# Altium schematic sheet MCU.SchDoc
size A4; SheetNumber: 2; SheetTotal: 5; ENG_APP_DATE: --/--/--; DSN_APP_DATE: --/--/--; CHK_APP_DATE: --/--/--
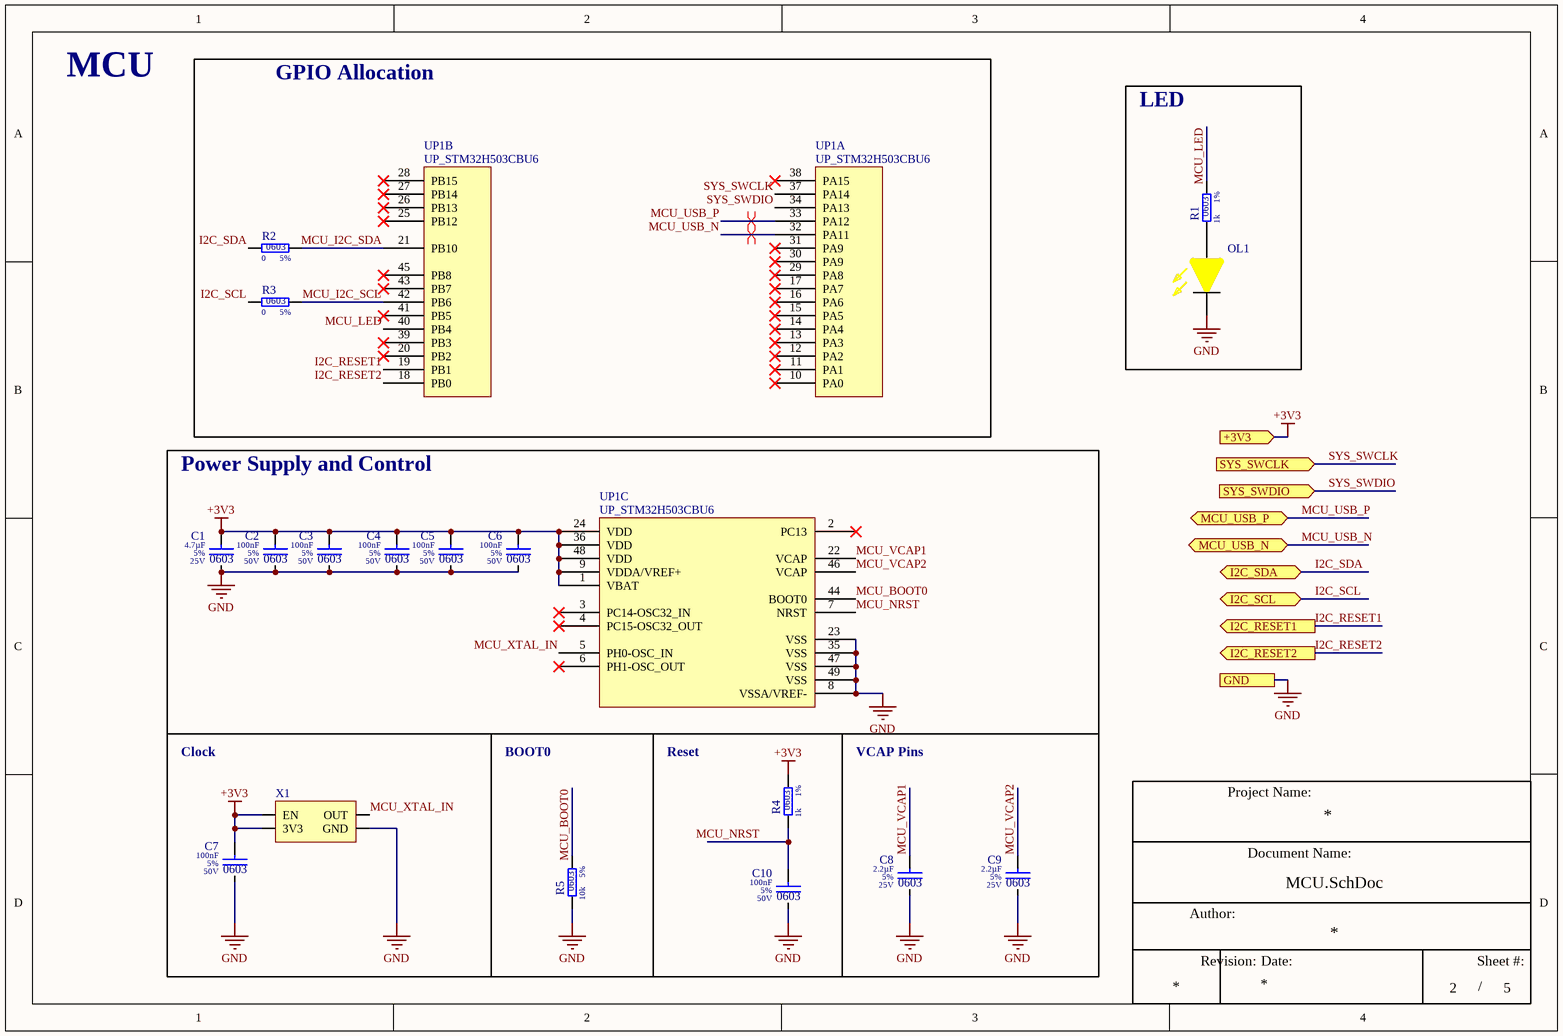
[diagram p0: MCU.SchDoc]

## Parts
C1  value 4.7µF  Tolerance: 5%  Voltage Rating: 25V  Case/Package: 0603  [0603_Capacitor]  (hidden comment: C_4.7u_25V_0603_5)
C2  value 100nF  Tolerance: 5%  Voltage Rating: 50V  Case/Package: 0603  [0603_Capacitor]  (hidden comment: C_100n_50V_0603_5)
C3  value 100nF  Tolerance: 5%  Voltage Rating: 50V  Case/Package: 0603  [0603_Capacitor]  (hidden comment: C_100n_50V_0603_5)
C4  value 100nF  Tolerance: 5%  Voltage Rating: 50V  Case/Package: 0603  [0603_Capacitor]  (hidden comment: C_100n_50V_0603_5)
C5  value 100nF  Tolerance: 5%  Voltage Rating: 50V  Case/Package: 0603  [0603_Capacitor]  (hidden comment: C_100n_50V_0603_5)
C6  value 100nF  Tolerance: 5%  Voltage Rating: 50V  Case/Package: 0603  [0603_Capacitor]  (hidden comment: C_100n_50V_0603_5)
C7  value 100nF  Tolerance: 5%  Voltage Rating: 50V  Case/Package: 0603  [0603_Capacitor]  (hidden comment: C_100n_50V_0603_5)
C8  value 2.2µF  Tolerance: 5%  Voltage Rating: 25V  Case/Package: 0603  [0603_Capacitor]  (hidden comment: C_2.2u_25V_0603_5)
C9  value 2.2µF  Tolerance: 5%  Voltage Rating: 25V  Case/Package: 0603  [0603_Capacitor]  (hidden comment: C_2.2u_25V_0603_5)
C10  value 100nF  Tolerance: 5%  Voltage Rating: 50V  Case/Package: 0603  [0603_Capacitor]  (hidden comment: C_100n_50V_0603_5)
OL1  SML-LX0603SYW-TR  [LEDC1608X60N]  (value not drawn)
R1  Tolerance: 1%  Resistance: 1k  Case/Package: 0603  [0603_Resistor]  (hidden comment: R_1k_0603_1)
R2  Tolerance: 5%  Resistance: 0  Case/Package: 0603  [0603_Resistor]  (hidden comment: R_0_0603_5)
R3  Tolerance: 5%  Resistance: 0  Case/Package: 0603  [0603_Resistor]  (hidden comment: R_0_0603_5)
R4  Tolerance: 1%  Resistance: 1k  Case/Package: 0603  [0603_Resistor]  (hidden comment: R_1k_0603_1)
R5  Tolerance: 5%  Resistance: 10k  Case/Package: 0603  [0603_Resistor]  (hidden comment: R_10k_0603_5)
UP1  UP_STM32H503CBU6  [UFQFPN48]  (parts A,B,C of 3)
X1  X_16MHz_LFSPXO066657CUTT  [X_2mm_2.5mm_oscillator]  (value not drawn)

## Blocks framed on the sheet
GPIO Allocation: R2 R3 UP1
LED: OL1 R1
Power Supply and Control: C1-C10 R4 R5 UP1 X1

## Ports
+3V3 (in), GND, I2C_RESET1 (out), I2C_RESET2 (out), I2C_SCL (bidir), I2C_SDA (bidir), MCU_USB_N (bidir), MCU_USB_P (bidir), SYS_SWCLK (in), SYS_SWDIO (in)

## Nets
+3V3: C1.1 C2.1 C3.1 C4.1 C5.1 C6.1 C7.1 R4.2 UP1.1(VBAT) UP1.9(VDDA/VREF+) UP1.24(VDD) UP1.36(VDD) UP1.48(VDD) X1.1(EN) X1.4(3V3) ; port +3V3
GND: C1.2 C2.2 C3.2 C4.2 C5.2 C6.2 C7.2 C8.2 C9.2 C10.2 OL1.1(K) R5.1 UP1.8(VSSA/VREF-) UP1.23(VSS) UP1.35(VSS) UP1.47(VSS) UP1.49(VSS) X1.2(GND) ; port GND
I2C_RESET1: UP1.19(PB1) ; port I2C_RESET1
I2C_RESET2: UP1.18(PB0) ; port I2C_RESET2
I2C_SCL: R3.1 ; port I2C_SCL
I2C_SDA: R2.1 ; port I2C_SDA
MCU_BOOT0: R5.2 UP1.44(BOOT0)
MCU_I2C_SCL: R3.2 UP1.42(PB6)
MCU_I2C_SDA: R2.2 UP1.21(PB10)
MCU_LED: R1.2 UP1.40(PB4)
MCU_NRST: C10.1 R4.1 UP1.7(NRST)
MCU_USB_N: UP1.32(PA11) ; port MCU_USB_N
MCU_USB_P: UP1.33(PA12) ; port MCU_USB_P
MCU_VCAP1: C8.1 UP1.22(VCAP)
MCU_VCAP2: C9.1 UP1.46(VCAP)
MCU_XTAL_IN: UP1.5(PH0-OSC_IN) X1.3(OUT)
SYS_SWCLK: UP1.37(PA14) ; port SYS_SWCLK
SYS_SWDIO: UP1.34(PA13) ; port SYS_SWDIO
NetOL1_2: OL1.2(A) R1.1

Not connected (* = marked no-connect by the designer): UP1 2(PC13)* 3(PC14-OSC32_IN)* 4(PC15-OSC32_OUT)* 6(PH1-OSC_OUT)* 10(PA0)* 11(PA1)* 12(PA2)* 13(PA3)* 14(PA4)* 15(PA5)* 16(PA6)* 17(PA7)* 20(PB2)* 25(PB12)* 26(PB13)* 27(PB14)* 28(PB15)* 29(PA8)* 30(PA9)* 31(PA9)* 38(PA15)* 39(PB3)* 41(PB5)* 43(PB7)* 45(PB8)*

## Layout directives
differential pair: MCU_USB_N, MCU_USB_P

## Notes on the sheet
- MCU
- Clock
- BOOT0
- (near UP1) Reset
- VCAP Pins
- Project Name:
- Author:
- Document Name:
- Revision:
- Date:
- Sheet #:
- /

## Library data of the parts
C1 = CMP-001-00011-26: Revision Num.: 1; Capacitor Type: Ceramic; Mounting Technology: SMT; HelpURL: https://eu.mouser.com/datasheet/2/40/cx5r_KGM-3223198.pdf
C2-C7 C10 = CMP-001-00008-27: Capacitor Type: Ceramic; Revision Num.: 1; HelpURL: https://www.tme.eu/Document/78f46414e6dac38b7cca12338ea208b0/X7RDielectric.pdf; Mounting Technology: SMT
C8 C9 = CMP-001-00022-24: Capacitor Type: Ceramic; Revision Num.: 1; Mounting Technology: SMT; HelpURL: https://eu.mouser.com/datasheet/2/281/1/GRT188C71E225KE13_01A-3158366.pdf
OL1 = SML-LX0603SYW-TR: LED; Manufacturer_Name: Lumex; Datasheet Link: https://datasheet.datasheetarchive.com/originals/distributors/Datasheets-AE/DSA3AE0000479.pdf; Height: 0.85mm; Manufacturer_Part_Number: SML-LX0603SYW-TR; Mouser Part Number: 696-SML-LX0603SYW; Mouser Price/Stock: https://www.mouser.co.uk/ProductDetail/Lumex/SML-LX0603SYW-TR?qs=lPH1AmYLb0wIUT30EAX6ng%3D%3D; Arrow Part Number: SML-LX0603SYW-TR; Arrow Price/Stock: https://www.arrow.com/en/products/sml-lx0603syw-tr/lumex?utm_currency=USD&region=nac
R1 R4 = CMP-009-00099-4: Revision Num.: 1; Voltage Rating: 75V; Power: 100mW; HelpURL: https://www.tme.eu/Document/622e28308c06d160637f2b14751ba16b/Data%20Sheet%20CRCW_BCe3.pdf; Mounting Technology: SMT
R2 R3 = CMP-009-00016-20: Power: 100mW; Revision Num.: 1; Voltage Rating: 50V; Mounting Technology: SMT; HelpURL: https://www.tme.eu/Document/c283990e907c122bb808207d1578ac7f/POWER_RATING-DTE.pdf
R5 = CMP-009-00002-21: Power: 100mW; Revision Num.: 1; Voltage Rating: 50V; Mounting Technology: SMT; HelpURL: https://www.tme.eu/Document/d2a72e545e5c8eb7bf2a04fa97535928/rc0603yageo.pdf
UP1 = CMP-020-00035-2: MCU Arm Cortex-M33 32-bit 250MHz, 128 Kbytes of Flash, 32 Kbytes of RAM, I3C; Revision Num.: 1; ROM Size: 128kB; Max Supply Voltage: 3.6V; RAM Size: 32kB; Min Supply Voltage: 1.71V; Case/Package: UFQFPN32; HelpURL: https://www.st.com/resource/en/datasheet/stm32h503eb.pdf; Series: STM32H503xx; Mounting Technology: SMT; Clock Frequency: 250MHz; Pins: 48; Man. Part Num.: STM32H503CBU6
X1 = X_16MHz_LFSPXO066657CUTT-10: Quartz generator; 16MHz; 50ppm; SMT; Rated Supply Voltage: 3.3V; Revision Num.: 1; Frequency: 16MHz; Case/Package: 2.5mm x 2.1mm; Mounting Technology: SMT; Tolerance: 50ppm; HelpURL: https://www.tme.eu/Document/f2507c161887e0dea281275093e92f79/LFSPXO066657CUTT.pdf; Man. Part Num.: LFSPXO066657CUTT